# Altium schematic sheet USBtoUART.SchDoc
size 209 x 297 mm; SheetNumber: 2; SheetTotal: 3
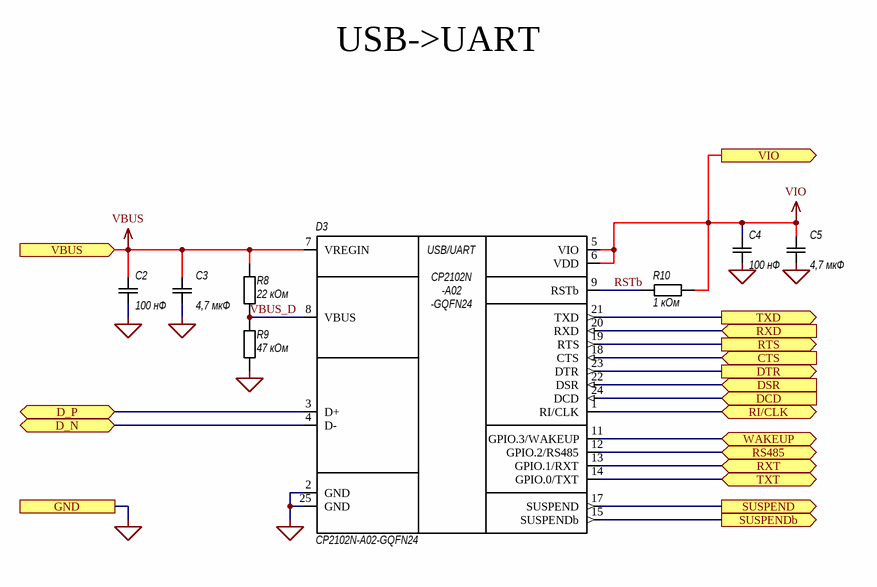
[diagram p0: USBtoUART.SchDoc]

## Parts
C2  100 нФ  [CAPC2012X135N]
C3  4,7 мкФ  [CAPC2012X135N]
C4  100 нФ  [CAPC2012X135N]
C5  4,7 мкФ  [CAPC2012X135N]
D3  CP2102N-A02-GQFN24  [CP2102N-A02-GQFN24_DS15]
R8  22 кОм  [RESC2012X70N]
R9  47 кОм  [RESC2012X70N]
R10  1 кОм  [RESC2012X70N]

## Ports
CTS (in, see MAIN[2A]), D_N (bidir, see MAIN[1A]), D_P (bidir, see MAIN[1A]), DCD (in, see MAIN[2A]), DSR (in, see MAIN[2A]), DTR (out, see MAIN[2A]), GND (see MAIN[1A], UARTtoRS485[1A]), RI/CLK (bidir, see MAIN[2A]), RS485 (bidir, see MAIN[2A]), RTS (out, see MAIN[2A]), RXD (in, see MAIN[2A]), RXT (bidir, see MAIN[2A]), SUSPEND (out, see MAIN[2A]), SUSPENDb (out, see MAIN[2A]), TXD (out, see MAIN[2A]), TXT (bidir, see MAIN[2A]), VBUS (in, see MAIN[1A], UARTtoRS485[1A]), VIO (out, see MAIN[2A], UARTtoRS485[1A]), WAKEUP (bidir, see MAIN[2A])

## Nets
GND: C2.1 C3.1 C4.1 C5.1 D3.2(GND) D3.25(GND) R9.1 ; port GND
VBUS: C2.2 C3.2 D3.7(VREGIN) R8.2 ; port VBUS
VIO: C4.2 C5.2 D3.5(VIO) D3.6(VDD) R10.2 ; port VIO
CTS: D3.18(CTS) ; port CTS
D_N: D3.4(D-) ; port D_N
D_P: D3.3(D+) ; port D_P
DCD: D3.24(DCD) ; port DCD
DSR: D3.22(DSR) ; port DSR
DTR: D3.23(DTR) ; port DTR
RI/CLK: D3.1(RI/CLK) ; port RI/CLK
RS485: D3.12(GPIO.2/RS485) ; port RS485
RSTb: D3.9(RSTb) R10.1
RTS: D3.19(RTS) ; port RTS
RXD: D3.20(RXD) ; port RXD
RXT: D3.13(GPIO.1/RXT) ; port RXT
SUSPEND: D3.17(SUSPEND) ; port SUSPEND
SUSPENDb: D3.15(SUSPENDb) ; port SUSPENDb
TXD: D3.21(TXD) ; port TXD
TXT: D3.14(GPIO.0/TXT) ; port TXT
VBUS_D: D3.8(VBUS) R8.1 R9.2
WAKEUP: D3.11(GPIO.3/WAKEUP) ; port WAKEUP

Not connected (* = marked no-connect by the designer): D3 10(NC) 16(NC)

## Notes on the sheet
- USB->UART
- Подп. дата
- Инв. № дубл.
- Взам. инв. №
- Подп. и дата
- Инв. № подл.
- Изм.
- Лист
- № докум.
- Подп.
- Дата
- ALTIUM GOSTBOM2.0 KEV
- Копировал
- Формат А4
- (in symbol U0002) USB/UART; CP2102N; -A02; -GQFN24

## Library data of the parts
C2 C4 = C0132: Конденсатор 100 нФ ±20% 100 В X7R 0805; Manufacturer: YAGEO; MPN: CC0805MKX7R0BB104; ID: C0132; Value: 100n; Voltage: 100 В; Notes: YAGEO CC; список 20.10.2026; CapacitanceNominalF: 1E-7; DissipationFactorMax: 0.025; DFTestFrequencyHz: 1000; DFTestVoltageVrms: 1; DFTestTemperatureC: 20; InsulationTimeConstantMinS: 500; InsulationResistanceMinOhm: 5000000000; InsulationTestVoltageV: 100; InsulationTestDurationS: 60; EquivalentSeriesResistanceOhm: 39.7887357729738; Type: Конденсатор; ESKD_value: 100 нФ; Tolerance: ±20%; Package: 0805; CommentBase: Конденсатор 100 нФ ±20% 100 В X7R 0805; Dielectric: X7R; ComponentLink2URL: https://yageogroup.com/content/datasheet/asset/file/UPY-GPHC_X7R_6_3V-TO-250V; ComponentLink2Description: Даташит — производитель; HelpURL: C:\Users\Nomatin\Documents\Altium\MY_LIB\MY_LIB\Datasheets\YAGEO_CC_X7R.pdf; ComponentLink1URL: C:\Users\Nomatin\Documents\Altium\MY_LIB\MY_LIB\Datasheets\YAGEO_CC_X7R.pdf; ComponentLink1Description: Даташит — локальный; Datasheet: C:\Users\Nomatin\Documents\Altium\MY_LIB\MY_LIB\Datasheets\YAGEO_CC_X7R.pdf
C3 C5 = C0140: Конденсатор 4,7 мкФ ±20% 25 В X7R 0805; Manufacturer: YAGEO; MPN: CC0805MKX7R8BB475; ID: C0140; Value: 4.7u; Voltage: 25 В; Notes: YAGEO CC; список 20.10.2026; CapacitanceNominalF: 4.7E-6; DissipationFactorMax: 0.1; DFTestFrequencyHz: 1000; DFTestVoltageVrms: 1; DFTestTemperatureC: 20; InsulationTimeConstantMinS: 100; InsulationResistanceMinOhm: 21276595.7446809; InsulationTestVoltageV: 25; InsulationTestDurationS: 60; EquivalentSeriesResistanceOhm: 3.38627538493394; Type: Конденсатор; ESKD_value: 4,7 мкФ; Tolerance: ±20%; Package: 0805; CommentBase: Конденсатор 4,7 мкФ ±20% 25 В X7R 0805; Dielectric: X7R; ComponentLink2URL: https://yageogroup.com/content/datasheet/asset/file/UPY-GPHC_X7R_6_3V-TO-250V; ComponentLink2Description: Даташит — производитель; HelpURL: C:\Users\Nomatin\Documents\Altium\MY_LIB\MY_LIB\Datasheets\YAGEO_CC_X7R.pdf; ComponentLink1URL: C:\Users\Nomatin\Documents\Altium\MY_LIB\MY_LIB\Datasheets\YAGEO_CC_X7R.pdf; ComponentLink1Description: Даташит — локальный; Datasheet: C:\Users\Nomatin\Documents\Altium\MY_LIB\MY_LIB\Datasheets\YAGEO_CC_X7R.pdf
D3 = U0002: Микросхема CP2102N-A02-GQFN24; Manufacturer: Silicon Labs; ID: U0002; Voltage: 3.0–3.6 V (VDD); 3.0–5.25 V (VREGIN); Notes: USB–UART, до 3 Мбод. EP=25 (GND). TA −40…+85 °C: табл. 3.1. Tj −40…+105 °C и хранение: absolute maximum, табл. 3.10.; TemperatureReference: TA (ambient), °C; recommended operating; JunctionTemperatureMin: -40; JunctionTemperatureMax: 105; Type: Микросхема; Value: CP2102N-A02-GQFN24; ESKD_value: CP2102N-A02-GQFN24; Package: QFN-24 4×4 mm, EP; MPN: CP2102N-A02-GQFN24; CommentBase: Микросхема CP2102N-A02-GQFN24; OperatingTemperatureMin: -40; OperatingTemperatureMax: 85; StorageTemperatureMin: -65; StorageTemperatureMax: 150; Datasheet: C:\Users\Nomatin\Documents\Altium\MY_LIB\MY_LIB\Datasheets\cp2102n-datasheet.pdf; DatasheetRevision: Rev. 1.5; ComponentLink1Description: Даташит — локальный; ComponentLink1URL: C:\Users\Nomatin\Documents\Altium\MY_LIB\MY_LIB\Datasheets\cp2102n-datasheet.pdf; ComponentLink2Description: Даташит — производитель; ComponentLink2URL: https://www.silabs.com/documents/public/data-sheets/cp2102n-datasheet.pdf; HelpURL: C:\Users\Nomatin\Documents\Altium\MY_LIB\MY_LIB\Datasheets\cp2102n-datasheet.pdf
R8 = R0258: Резистор 22 кОм ±5% 0805; Manufacturer: YAGEO; MPN: RC0805JR-0722KL; ID: R0258; Value: 22k; Power: 0,125 Вт; Voltage: 150 В макс.; Notes: RC_L; E24; P при 70 °C; SPICE: +100 ppm/°C при 25 °C — положительная граница ±100, не измеренный ТКС (RC_L, табл.2/5, стр.5/8).; TCR: ±100 ppm/°C; Type: Резистор; ESKD_value: 22 кОм; Tolerance: ±5%; Package: 0805; CommentBase: Резистор 22 кОм ±5% 0805; ComponentLink2URL: https://yageogroup.com/content/datasheet/asset/file/PYU-RC_GROUP_51_ROHS_L; ComponentLink2Description: Даташит — производитель; HelpURL: C:\Users\Nomatin\Documents\Altium\MY_LIB\MY_LIB\Datasheets\YAGEO_RC_L.pdf; ComponentLink1URL: C:\Users\Nomatin\Documents\Altium\MY_LIB\MY_LIB\Datasheets\YAGEO_RC_L.pdf; ComponentLink1Description: Даташит — локальный; Datasheet: C:\Users\Nomatin\Documents\Altium\MY_LIB\MY_LIB\Datasheets\YAGEO_RC_L.pdf
R9 = R0266: Резистор 47 кОм ±5% 0805; Manufacturer: YAGEO; MPN: RC0805JR-0747KL; ID: R0266; Value: 47k; Power: 0,125 Вт; Voltage: 150 В макс.; Notes: RC_L; E24; P при 70 °C; SPICE: +100 ppm/°C при 25 °C — положительная граница ±100, не измеренный ТКС (RC_L, табл.2/5, стр.5/8).; TCR: ±100 ppm/°C; Type: Резистор; ESKD_value: 47 кОм; Tolerance: ±5%; Package: 0805; CommentBase: Резистор 47 кОм ±5% 0805; ComponentLink2URL: https://yageogroup.com/content/datasheet/asset/file/PYU-RC_GROUP_51_ROHS_L; ComponentLink2Description: Даташит — производитель; HelpURL: C:\Users\Nomatin\Documents\Altium\MY_LIB\MY_LIB\Datasheets\YAGEO_RC_L.pdf; ComponentLink1URL: C:\Users\Nomatin\Documents\Altium\MY_LIB\MY_LIB\Datasheets\YAGEO_RC_L.pdf; ComponentLink1Description: Даташит — локальный; Datasheet: C:\Users\Nomatin\Documents\Altium\MY_LIB\MY_LIB\Datasheets\YAGEO_RC_L.pdf
R10 = R0226: Резистор 1 кОм ±5% 0805; Manufacturer: YAGEO; MPN: RC0805JR-071KL; ID: R0226; Value: 1k; Power: 0,125 Вт; Voltage: 150 В макс.; Notes: RC_L; E24; P при 70 °C; SPICE: +100 ppm/°C при 25 °C — положительная граница ±100, не измеренный ТКС (RC_L, табл.2/5, стр.5/8).; TCR: ±100 ppm/°C; Type: Резистор; ESKD_value: 1 кОм; Tolerance: ±5%; Package: 0805; CommentBase: Резистор 1 кОм ±5% 0805; ComponentLink2URL: https://yageogroup.com/content/datasheet/asset/file/PYU-RC_GROUP_51_ROHS_L; ComponentLink2Description: Даташит — производитель; HelpURL: C:\Users\Nomatin\Documents\Altium\MY_LIB\MY_LIB\Datasheets\YAGEO_RC_L.pdf; ComponentLink1URL: C:\Users\Nomatin\Documents\Altium\MY_LIB\MY_LIB\Datasheets\YAGEO_RC_L.pdf; ComponentLink1Description: Даташит — локальный; Datasheet: C:\Users\Nomatin\Documents\Altium\MY_LIB\MY_LIB\Datasheets\YAGEO_RC_L.pdf